# Altium schematic sheet diff_amp.SchDoc
size A4; CompanyName: MCI Management Center Innsbruck; Address1: Universitätsstraße 15; Address2: A-6020 Innsbruck
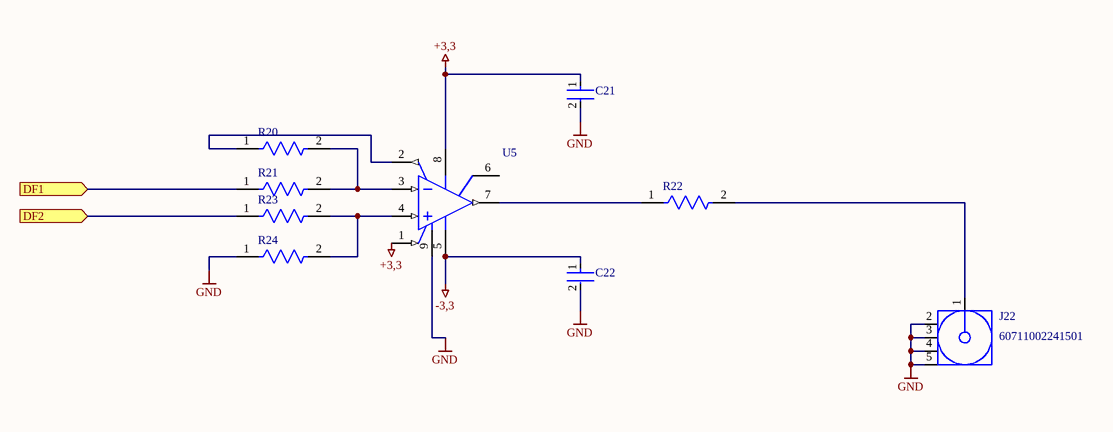
[diagram p0: diff_amp.SchDoc]

## Parts
C21  CGA2B3X7R1E104K050BB  [FP-CGA2B-IPC_B]  (value not drawn)
C22  CGA2B3X7R1E104K050BB  [FP-CGA2B-IPC_B]  (value not drawn)
J22  60711002241501  [60711002241501]
R20  RG1005N-4020-W-T5  [FP-RG1005-IPC_B]  (value not drawn)
R21  RG1005N-4020-W-T5  [FP-RG1005-IPC_B]  (value not drawn)
R22  RT0603BRE0749R9L  [FP-RT0603-MFG]  (value not drawn)
R23  RG1005N-4020-W-T5  [FP-RG1005-IPC_B]  (value not drawn)
R24  RG1005N-4020-W-T5  [FP-RG1005-IPC_B]  (value not drawn)
U5  ADA4817-1ACPZ-R7  [ADI-CP-8-2_L]  (value not drawn)

## Ports
DF1 (in), DF2 (in)

## Nets
+3,3: C21.1 U5.1(~{PD}) U5.8(+VS)
-3,3: C22.1 U5.5(-VS)
GND: C21.2 C22.2 J22.2(GND) J22.3(GND) J22.4(GND) J22.5(GND) R24.1 U5.9(EP)
DF1: R21.1 ; port DF1
DF2: R23.1 ; port DF2
NetJ22_1: J22.1(Signal) R22.2
NetR20_1: R20.1 U5.2(FB)
NetR20_2: R20.2 R21.2 U5.3(-IN)
NetR22_1: R22.1 U5.7(OUT)
NetR23_2: R23.2 R24.2 U5.4(+IN)

Not connected (* = marked no-connect by the designer): U5 6(NC)

## Notes on the sheet
- Size:
- Mechatronics - Electrical Engineering
- Project:
- A4
- Title:
- Date:
- Revision:
- Sheet:
- of
- File:
- Author:

## Library data of the parts
C21 C22 = CMP-2000-06086-2: Cap Ceramic 100nF 25V X7R 10% Pad SMD 0402 +125°C Automotive T/R; Lead Free: Lead Free; Termination: SMD/SMT; Voltage Rating: 25V; Voltage: 25V; Composition: Ceramic; Case/Package: 0402; Mount: Surface Mount; Voltage Rating (DC): 25V; Tolerance: 10%; Length: 1mm; Width: 0.02inch; REACH SVHC: No SVHC; Max Operating Temperature: 125°C; Case Code (Metric): 1005; Case Code (Imperial): 0402; Package Quantity: 1; Depth: 0.5mm; Min Operating Temperature: -55°C; Thickness: 0.022inch; Capacitance: 100nF; Height: 0.5mm; Dielectric: X7R; Packaging: Tape and Reel; Weight: 2.3E-05oz; Ratings: AEC-Q200
J22 = CMP-03913-154947495-1: Rf Coax Conn, Smc R/a Jack, 50 Ohm, Pcb Rohs Compliant: Yes
R20 R21 R23 R24 = CMP-28537-013757-1: Automotive Metal Thin Film Chip Resistor, 0402, 402Ω, 0.05%, 10ppm/°C, 0.0625W, 75V; Voltage Rating (DC): 25V; Resistance: 402R; Power Rating: 30mW; Max Power Dissipation: 63mW; Package Quantity: 5000; Case/Package: 0402; Max Operating Temperature: 155°C; Case Code (Imperial): 0402; Height: 0.016inch; Voltage Rating: 25V; Min Operating Temperature: -55°C; Temperature Coefficient: 10ppm/°C; Length: 0.039inch; Features: Automotive AEC-Q200; Width: 0.5mm; Series: RG; RoHS Compliant: Yes; Resistor Type: Thin Film; Packaging: Tape and Reel; Tolerance: 0.05%; Lead Free: Lead Free; Case Code (Metric): 1005; Number of Terminations: 2; Termination: SMD/SMT
R22 = CMP-2000-04544-2: RES SMD 49.9 OHM 0.1% 1/10W 0603; Manufacturer: Yageo; Temperature Coefficient: 50 ppm/°C; Tolerance: 0.001; Voltage Rating: 75V; Power Rating: 0.1W; Resistance: 49.9Ω; Value: 49.9Ω; ComponentLink2URL: http://www.yageo.com/documents/recent/PYu-RT_1-to-0.01_RoHS_L_9.pdf; Composition: Thin Film; Category: Res; Manufacturer Part Number: RT0603BRE0749R9L; Digikey Description: RES SMD 49.9 OHM 0.1% 1/10W 0603; RoHS: TRUE; Temperature Range Low: -55°C; Device Class L3: Chip SMD Resistors; Package: RT0603; Automotive: No; Temperature Range High: +155°C; Height: 0.55mm; Device Class L2: Resistors; Mouser Description: RT Series 0603 0.1 W 49.9 kOhm ±0.1 % ±50 ppm/°C SMT Thin Film Chip Resistor; Lead Free: Yes; Series: RT; Octopart: https://octopart.com/rt0603bre0749r9l-yageo-1456229; ComponentLink2Description: Datasheet; Footprint Url: http://www.yageo.com/exep/pages/download/literatures/PYu-R_Mount_10.pdf; Device Class L1: Passive Components; Temperature: -55°C to +155°C; Ipc Land Pattern Name: RESC16080X45
U5 = CMP-0384-00096-1: Single Channel Low Noise Operational Amplifier, 1.05 GHz BW, 870 V/us SR, Industrial, 8-pin QFN (CP-8-2), Reel; Manufacturer: Analog Devices; Iq/Amp: 21mA; Input Bias Current: 2pA; Amplifiers Per Package: 1; V Span Max: 10V; Input Offset Voltage: 2mV; V Span Min: 5V; DatasheetVersion: Rev. A; ComponentLink2URL: http://www.analog.com/static/imported-files/data_sheets/ADA4817-1_4817-2.pdf; ComponentLink1Description: Manufacturer URL; ComponentLink1URL: http://www.analog.com/en/index.html; PartNumber: ADA4817-1ACPZ-R7; PackageVersion: 061507-B; ComponentLink3URL: http://www.analog.com/static/imported-files/packages/56953322593982CP_8_2.pdf; Slew Rate: 870V/us; ComponentLink2Description: Datasheet; Generic Part Number: ADA4817-1; PackageReference: CP-8-2; Small Signal Bandwidth: 1.05GHz; Mounting Technology: Surface Mount; ComponentLink3Description: Package Specification; PackageDescription: 8-Pin Lead Frame Chip Scale Package, Body 3 x 3 mm, Pitch 0.5 mm